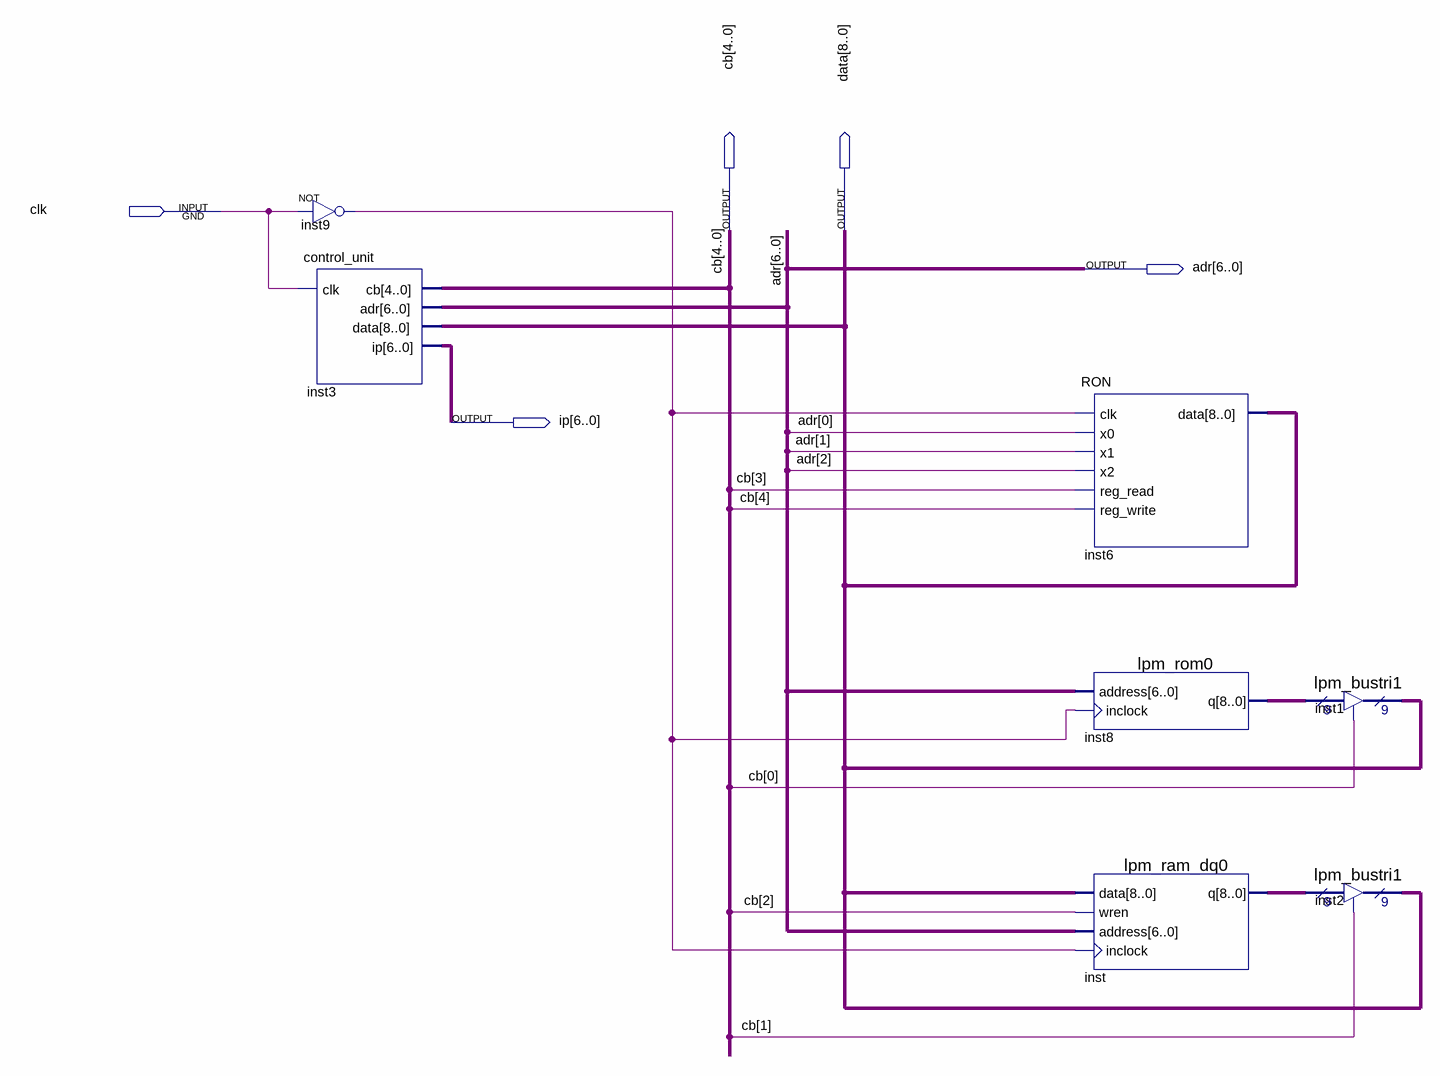
[diagram p0: schematic sheet]
// Quartus schematic lab4.bdf as structural Verilog: 7 symbols, 5 pins
module lab4 (
  input  clk,
  output [4:0] cb,
  output [8:0] data,
  output [6:0] adr,
  output [6:0] ip
);

  wire inst9_out;
  wire [8:0] inst8_q, inst_q;

  not inst9 (inst9_out, clk);
  control_unit inst3 (.clk(clk), .cb(cb), .adr(adr), .ip(ip), .data(data));
  RON inst6 (.clk(inst9_out), .x0(adr[0]), .x1(adr[1]), .x2(adr[2]), .reg_read(cb[3]), .reg_write(cb[4]), .data(data));
  lpm_rom0 inst8 (.address(adr), .inclock(inst9_out), .q(inst8_q));
  lpm_ram_dq0 inst (.data(data), .wren(cb[2]), .address(adr), .inclock(inst9_out), .q(inst_q));
  lpm_bustri1 inst1 (.enabledt(cb[0]), .data(inst8_q), .tridata(data));
  lpm_bustri1 inst2 (.enabledt(cb[1]), .data(inst_q), .tridata(data));
endmodule
